# Altium project Quadrupled Robot.PrjPcb
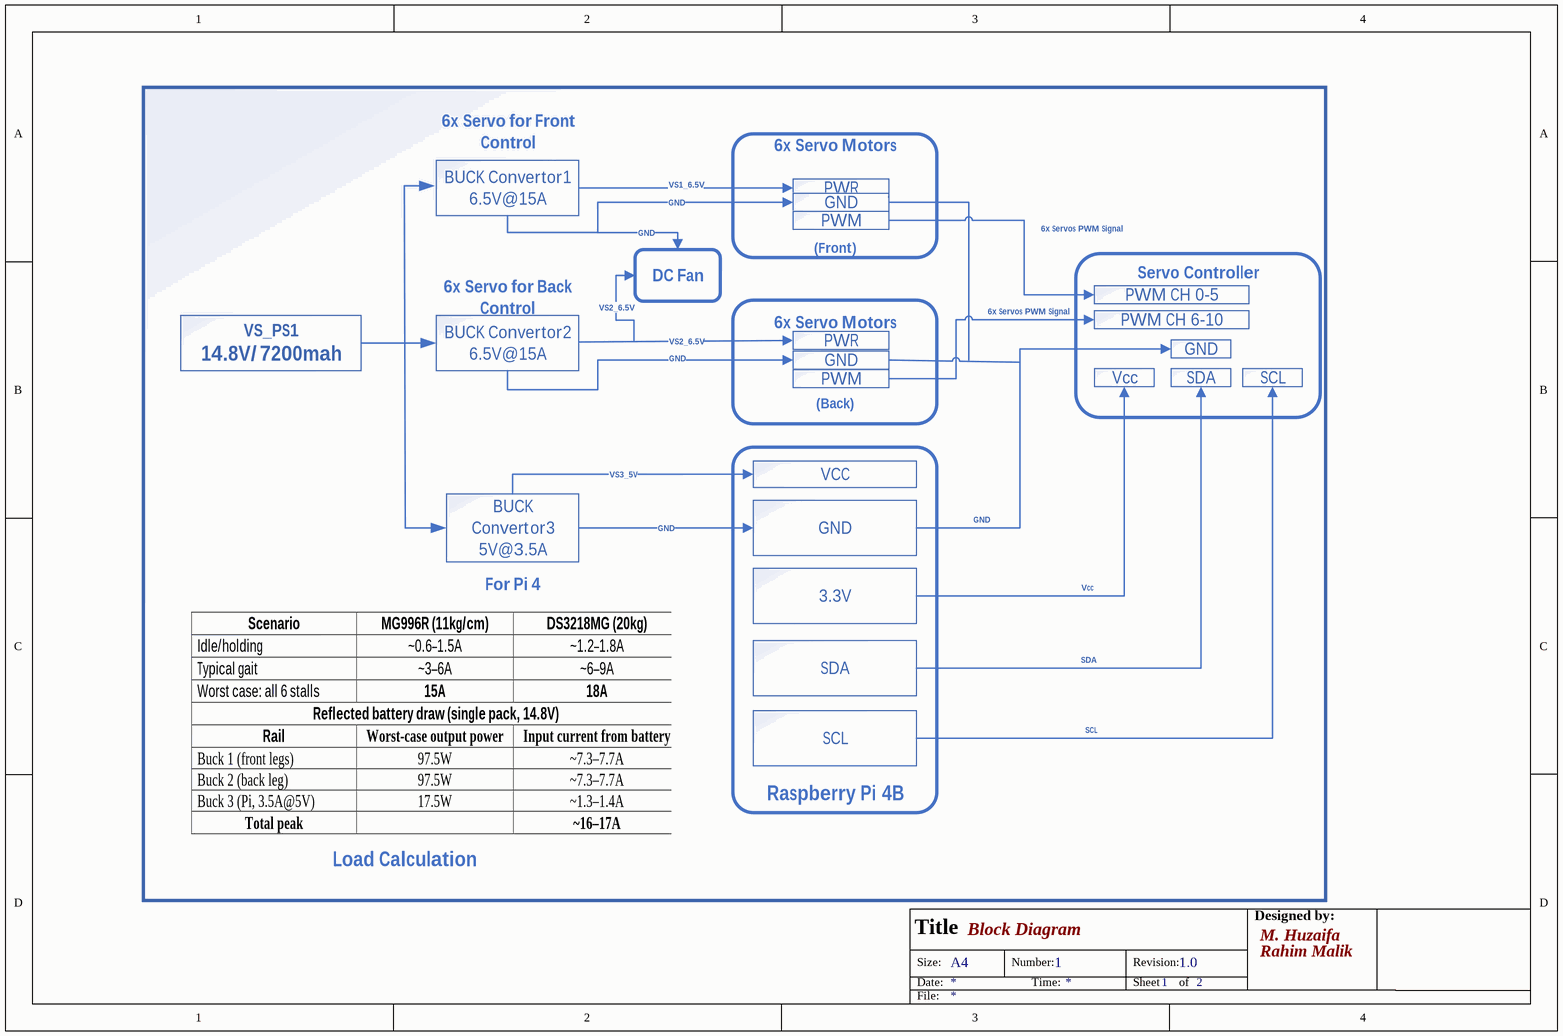
[diagram p0: Block Diagram.SchDoc]
2 sheets, 20 parts. Net scope: global (net labels, ports and power ports of the same name join across sheets).
Sheets:
  Block Diagram.SchDoc
  Schematic.SchDoc

## Sheet Block Diagram.SchDoc: Block Diagram
size A4; DocumentNumber: 1; Revision: 1.0; SheetNumber: 1; SheetTotal: 2

### Notes on the sheet
- Designed by:
- Title
- Size:
- Date:
- A4
- Number:
- Time:
- Revision:
- Sheet
- of
- M. Huzaifa
- Rahim Malik
- File:

## Sheet Schematic.SchDoc: Quadrupled Design
size A4; DocumentNumber: 2; Revision: 1.0; SheetNumber: 2; SheetTotal: 2
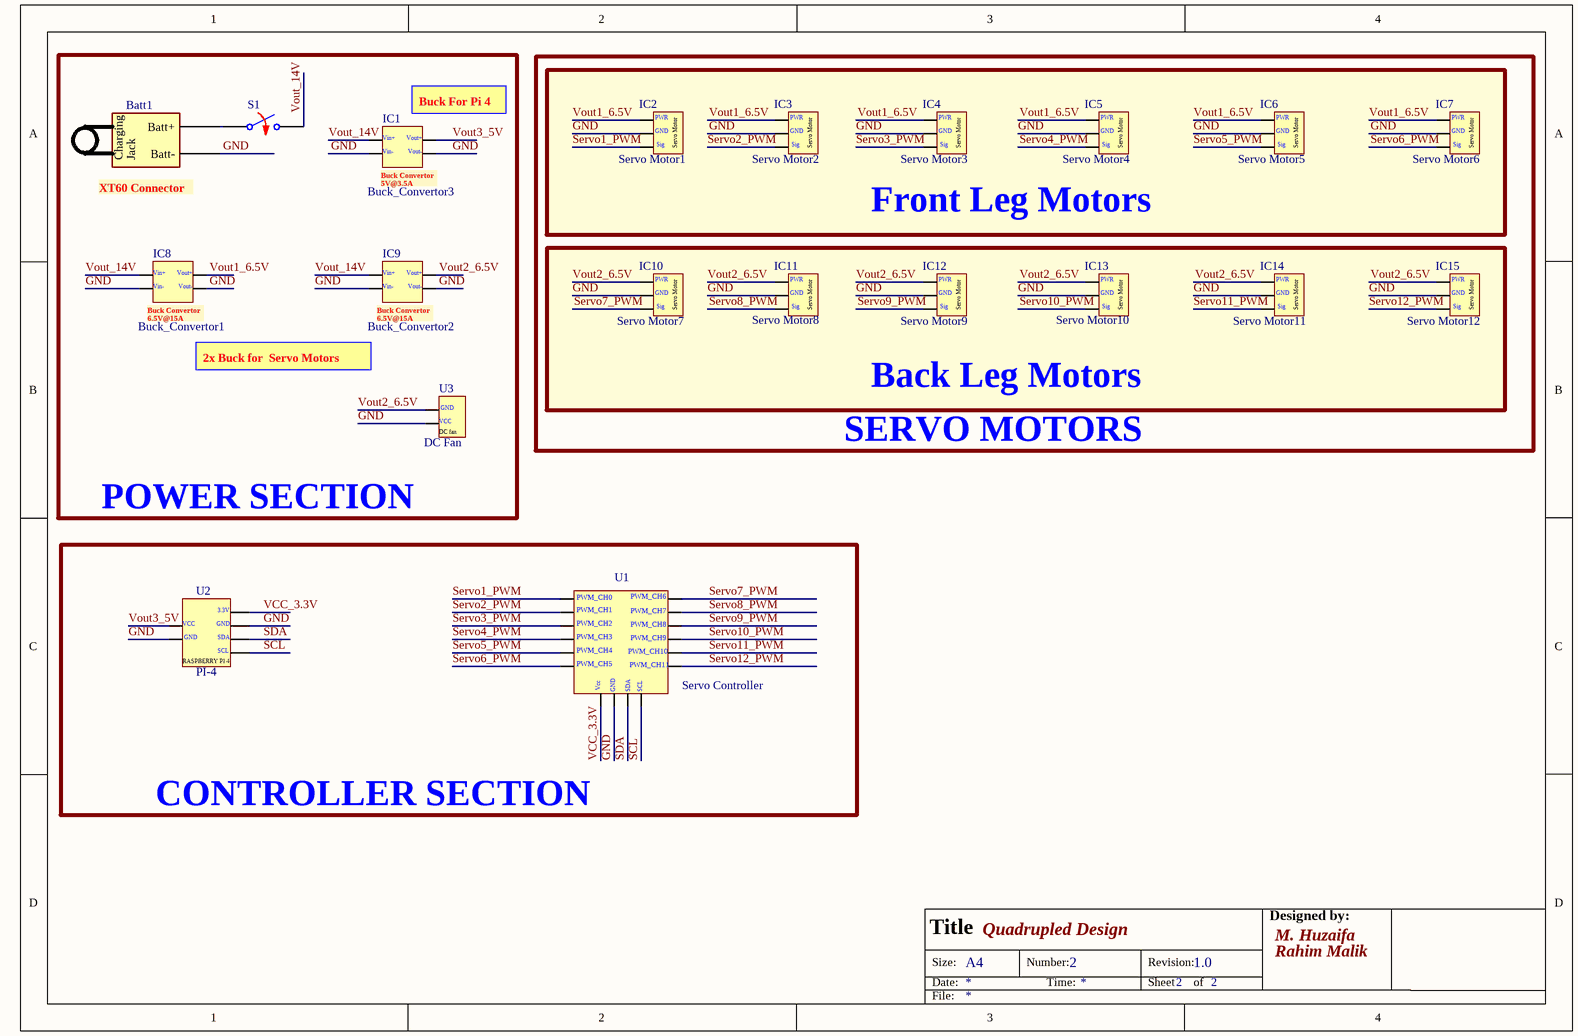
[diagram p1: Schematic.SchDoc]

### Parts
Batt1  Battery  (value not drawn)
IC1  Buck_Convertor3
IC2  Servo Motor1
IC3  Servo Motor2
IC4  Servo Motor3
IC5  Servo Motor4
IC6  Servo Motor5
IC7  Servo Motor6
IC8  Buck_Convertor1
IC9  Buck_Convertor2
IC10  Servo Motor7
IC11  Servo Motor8
IC12  Servo Motor9
IC13  Servo Motor10
IC14  Servo Motor11
IC15  Servo Motor12
S1  Switch Normally Opened  (value not drawn)
U1  Servo Controller
U2  PI-4
U3  DC Fan

### Blocks framed on the sheet
POWER SECTION: Batt1 IC1 IC8 IC9 S1 U3
Front Leg Motors: IC2-IC7
Back Leg Motors: IC10-IC15
CONTROLLER SECTION: U1 U2

### Nets
GND: Batt1.V-(Batt-)
Vout_14V: S1.2
NetBatt1_V+: Batt1.V+(Batt+) S1.1

### Notes on the sheet
- Buck For Pi 4
- 2x Buck for  Servo Motors
- SERVO MOTORS
- Designed by:
- Title
- Size:
- Date:
- A4
- Number:
- Time:
- Revision:
- Sheet
- of
- M. Huzaifa
- Rahim Malik
- File:
- (in symbol Battery) Charging; Jack; XT60 Connector
- (in symbol Buck_Convertor1) Vin+; Vout+; Vin-; Vout-; Buck Convertor 6.5V@15A
- (in symbol Buck_Convertor2) Vin+; Vout+; Vin-; Vout-; Buck Convertor 5V@3.5A
- (in symbol DC Fan) GND; VCC; DC fan
- (in symbol PI-4) 3.3V; VCC; GND; SDA; SCL; RASPBERRY PI 4
- (in symbol Servo Controller) PWM_CH6; PWM_CH0; PWM_CH1; PWM_CH7; PWM_CH2; PWM_CH8; PWM_CH3; PWM_CH9; PWM_CH4; PWM_CH10; PWM_CH5; PWM_CH11; Vcc; GND; SDA; SCL
- (in symbol Servo Motor) PWR; GND; Sig

### Library data of the parts
IC1 = Buck_Convertor2
IC2-IC7 IC10-IC15 = Servo Motor
IC9 = Buck_Convertor1
S1 = SW NO: closed: 0; Rclosed: 1m; Ropen: 1Meg; SimulationGenericComponent: True